# Altium schematic sheet Wifi_Coprocessor.SchDoc
size A3; SheetNumber: 4; SheetTotal: 5
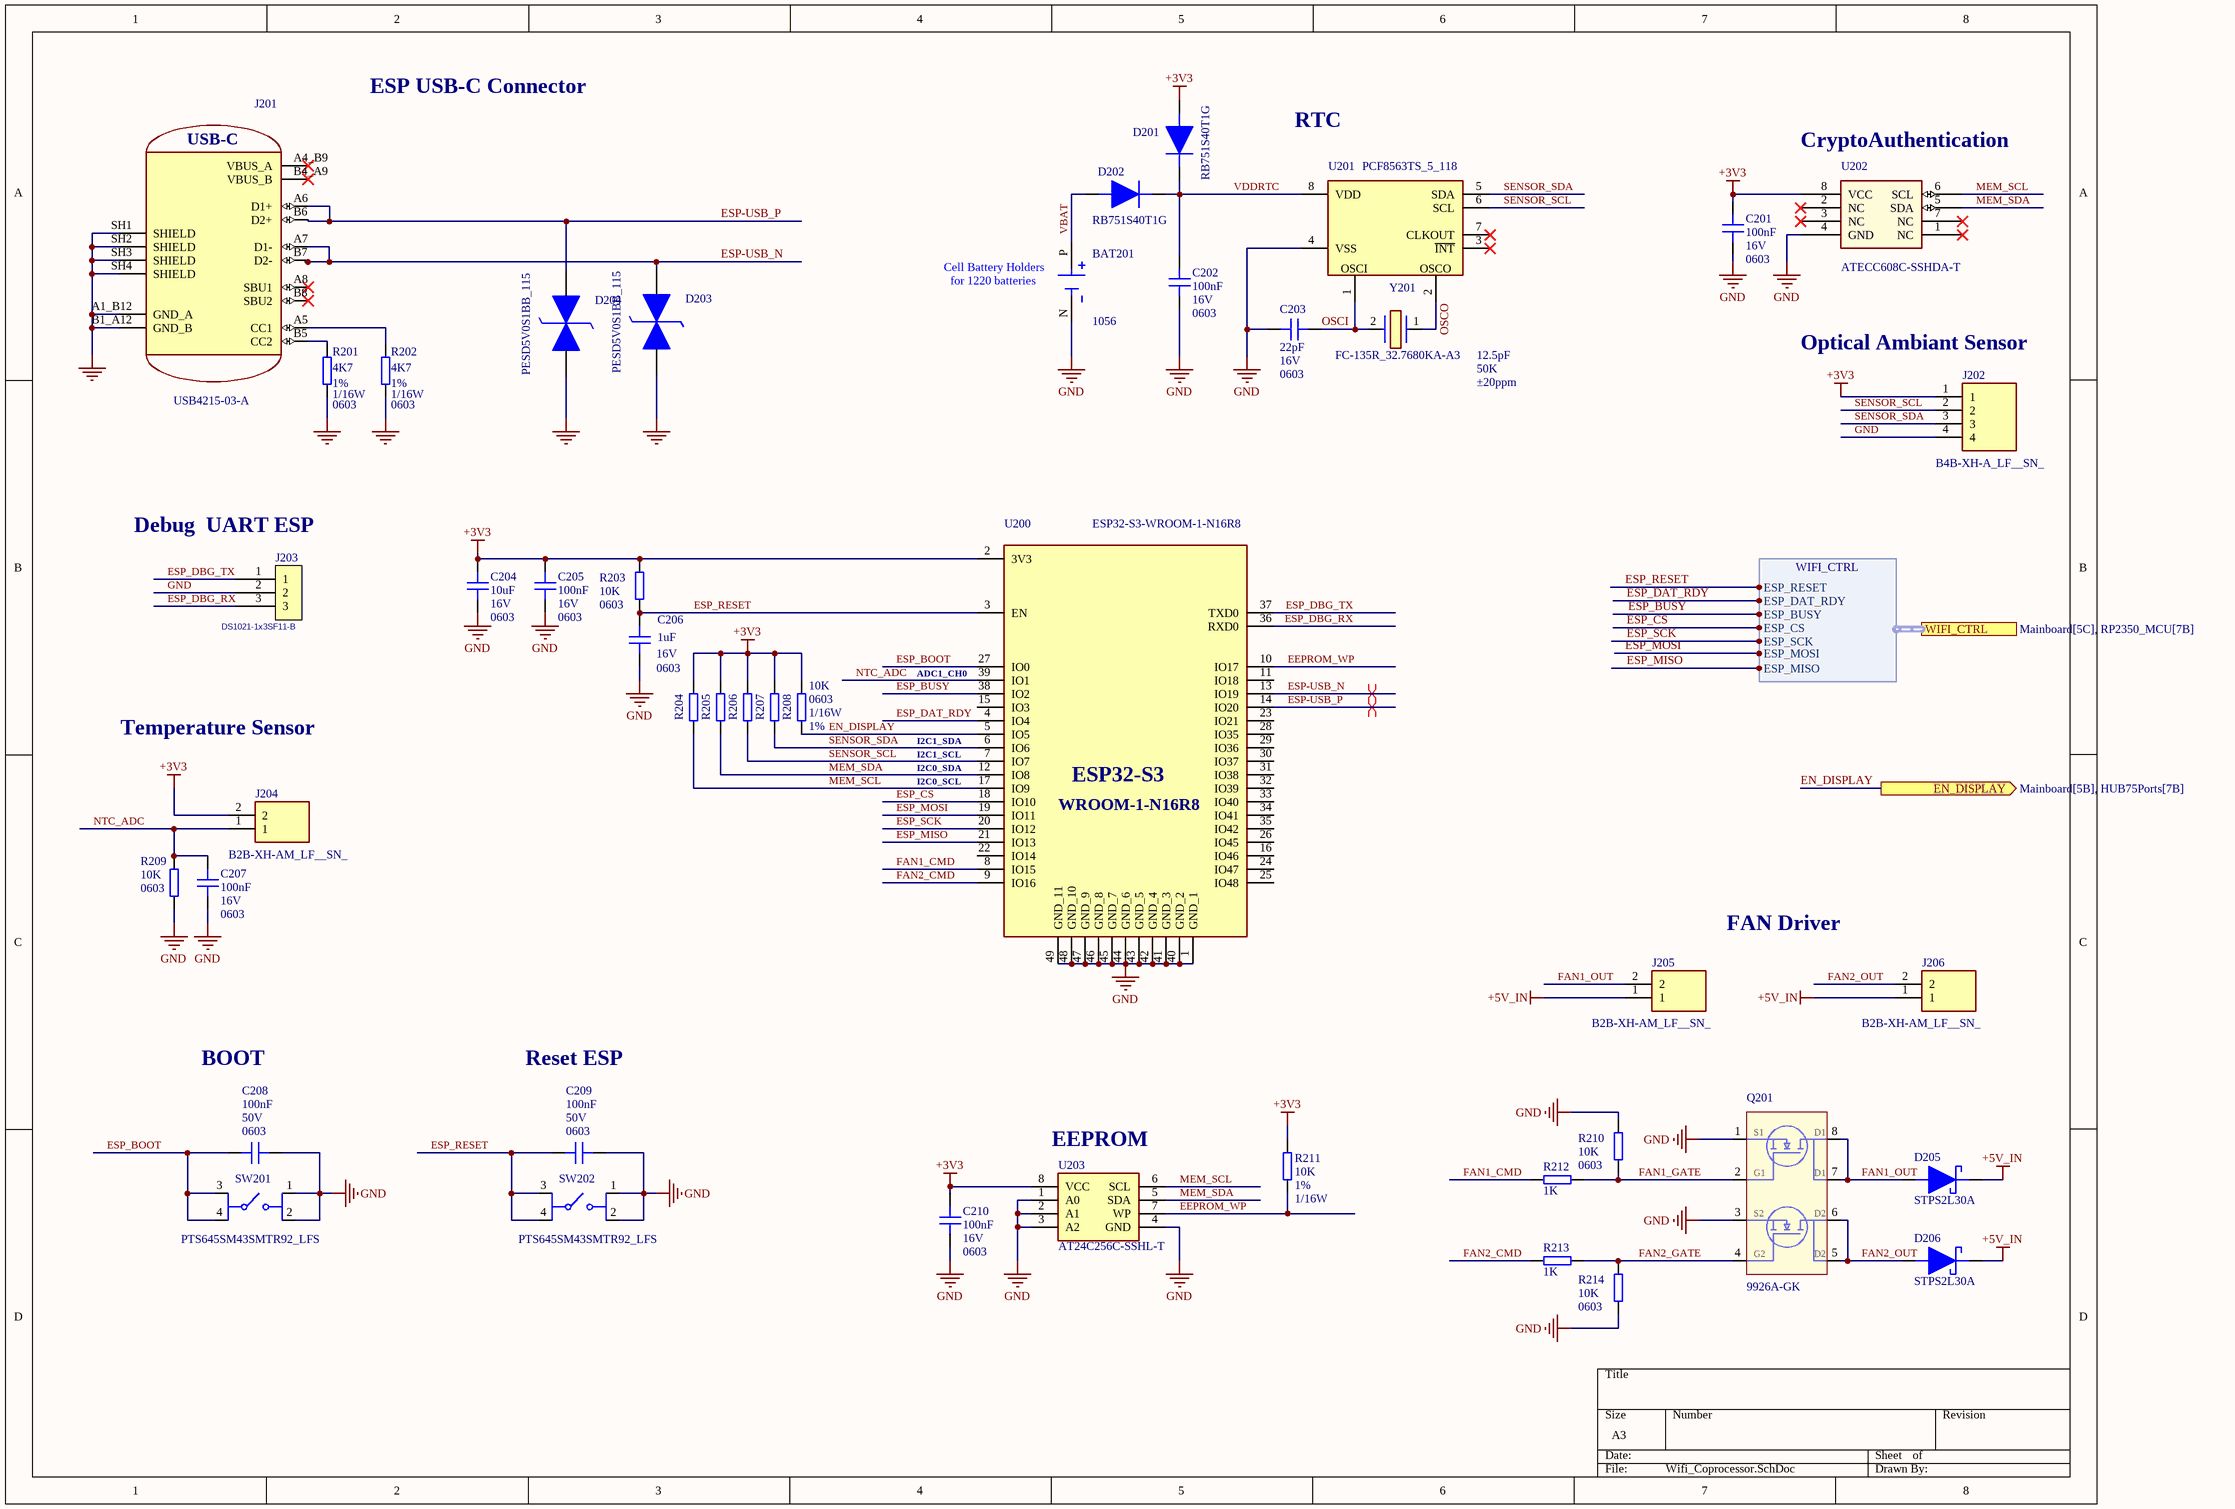
[diagram p0: Wifi_Coprocessor.SchDoc]

## Parts
BAT201  1056  [1056]
C201  100nF  Voltage: 16V  Package: 0603  [C0603]
C202  100nF  Voltage: 16V  Package: 0603  [C0603]
C203  22pF  Voltage: 16V  Package: 0603  [C0603]
C204  10uF  Voltage: 16V  Package: 0603  [C0603]
C205  100nF  Voltage: 16V  Package: 0603  [C0603]
C206  1uF  Voltage: 16V  Package: 0603  [C0603]
C207  100nF  Voltage: 16V  Package: 0603  [C0603]
C208  100nF  Voltage: 50V  Package: 0603  [C0603]
C209  100nF  Voltage: 50V  Package: 0603  [C0603]
C210  100nF  Voltage: 16V  Package: 0603  [C0603]
D201  RB751S40T1G  [SODFL1608X70N]
D202  RB751S40T1G  [SODFL1608X70N]
D203  PESD5V0S1BB_115  [SODFL1608X65N]
D204  PESD5V0S1BB_115  [SODFL1608X65N]
D205  STPS2L30A  [SMA_STM]
D206  STPS2L30A  [SMA_STM]
J201  USB4215-03-A  [GCT_USB4215-03-A_REVA]
J202  B4B-XH-A_LF__SN_  [B4BXHALFSN]
J203  DS1021-1x3SF11-B  [HDR-TH_3P-P2.54-V-M]
J204  B2B-XH-AM_LF__SN_  [B2BXHAMLFSN]
J205  B2B-XH-AM_LF__SN_  [B2BXHAMLFSN]
J206  B2B-XH-AM_LF__SN_  [B2BXHAMLFSN]
Q201  9926A-GK  [SOIC127P600X175-8N]
R201  4K7  Package: 0603  Tolerence: 1%  Power: 1/16W  [R0603_1608]
R202  4K7  Package: 0603  Tolerence: 1%  Power: 1/16W  [R0603_1608]
R203  10K  Package: 0603  [R0603_1608]
R204  10K  [R0603_1608]  (value not drawn)
R205  10K  [R0603_1608]  (value not drawn)
R206  10K  [R0603_1608]  (value not drawn)
R207  10K  [R0603_1608]  (value not drawn)
R208  Package: 0603  Tolerence: 1%  Power: 1/16W  [R0603_1608]  (hidden comment: 10K)
R209  10K  Package: 0603  [R0603_1608]
R210  10K  Package: 0603  [R0603_1608]
R211  Tolerence: 1%  Power: 1/16W  [R0603_1608]  (hidden comment: 10K)
R212  1K  [R0603_1608]
R213  1K  [R0603_1608]
R214  10K  Package: 0603  [R0603_1608]
SW201  PTS645SM43SMTR92_LFS  [PTS645SM43SMTR92LFS]
SW202  PTS645SM43SMTR92_LFS  [PTS645SM43SMTR92LFS]
U200  ESP32-S3-WROOM-1-N16R8  [ESP32S3WROOM1N16R8]
U201  PCF8563TS_5_118  [SOT65P490X110-8N]
U202  ATECC608C-SSHDA-T  [SOIC8_SWB_MCH]
U203  AT24C256C-SSHL-T  [24LC32A]
Y201  FC-135R_32.7680KA-A3  Load Capacitance: 12.5pF  ESR: 50K  Parameter 1: ±20ppm  [FC135R327680KAA3]

## Ports
EN_DISPLAY (out, see Mainboard[5B], HUB75Ports[7B]), WIFI_CTRL (harness WIFI_CTRL, see Mainboard[5C], RP2350_MCU[7B])

## Harnesses
WIFI_CTRL: ESP_RESET, ESP_DAT_RDY, ESP_BUSY, ESP_CS, ESP_SCK, ESP_MOSI, ESP_MISO

## Nets
+3V3: C201.2 C204.2 C205.2 C210.2 D201.2(A) J202.1 J204.2 R203.1 R204.1 R205.1 R206.1 R207.1 R208.1 R211.1 U200.2(3V3) U202.8(VCC) U203.8(VCC)
+5V_IN: D205.1(K) D206.1(K) J205.1 J206.1
GND: BAT201.N(NEG) C201.1 C202.1 C203.2 C204.1 C205.1 C206.1 C207.1 C208.1 C209.1 C210.1 D203.1(K1) D204.1(K1) J201.A1_B12(GND_A) J201.B1_A12(GND_B) J201.SH1(SHIELD) J201.SH2(SHIELD) J201.SH3(SHIELD) J201.SH4(SHIELD) J202.4 J203.2 Q201.1(S1) Q201.3(S2) R201.1 R202.1 R209.2 R210.1 R214.2 SW201.1(NO_1) SW201.2(NO_2) SW202.1(NO_1) SW202.2(NO_2) U200.1(GND_1) U200.40(GND_2) U200.41(GND_3) U200.42(GND_4) U200.43(GND_5) U200.44(GND_6) U200.45(GND_7) U200.46(GND_8) U200.47(GND_9) U200.48(GND_10) U200.49(GND_11) U201.4(VSS) U202.4(GND) U203.1(A0) U203.2(A1) U203.3(A2) U203.4(GND)
EEPROM_WP: R211.2 U200.10(IO17) U203.7(WP)
EN_DISPLAY: R208.2 U200.5(IO5) ; port EN_DISPLAY
ESP-USB_N: D203.2(K2) J201.A7(D1-) J201.B7(D2-) U200.13(IO19)
ESP-USB_P: D204.2(K2) J201.A6(D1+) J201.B6(D2+) U200.14(IO20)
ESP_BOOT: C208.2 SW201.3(COM_1) SW201.4(COM_2) U200.27(IO0)
ESP_BUSY: U200.38(IO2) ; port WIFI_CTRL.ESP_BUSY
ESP_CS: U200.18(IO10) ; port WIFI_CTRL.ESP_CS
ESP_DAT_RDY: U200.4(IO4) ; port WIFI_CTRL.ESP_DAT_RDY
ESP_DBG_RX: J203.3 U200.36(RXD0)
ESP_DBG_TX: J203.1 U200.37(TXD0)
ESP_MISO: U200.21(IO13) ; port WIFI_CTRL.ESP_MISO
ESP_MOSI: U200.19(IO11) ; port WIFI_CTRL.ESP_MOSI
ESP_RESET: C206.2 C209.2 R203.2 SW202.3(COM_1) SW202.4(COM_2) U200.3(EN) ; port WIFI_CTRL.ESP_RESET
ESP_SCK: U200.20(IO12) ; port WIFI_CTRL.ESP_SCK
FAN1_CMD: R212.1 U200.8(IO15)
FAN1_GATE: Q201.2(G1) R210.2 R212.2
FAN1_OUT: D205.2(A) J205.2 Q201.7(D1) Q201.8(D1)
FAN2_CMD: R213.1 U200.9(IO16)
FAN2_GATE: Q201.4(G2) R213.2 R214.1
FAN2_OUT: D206.2(A) J206.2 Q201.5(D2) Q201.6(D2)
MEM_SCL: R204.2 U200.17(IO9) U202.6(SCL) U203.6(SCL)
MEM_SDA: R205.2 U200.12(IO8) U202.5(SDA) U203.5(SDA)
NTC_ADC: C207.2 J204.1 R209.1 U200.39(IO1)
OSCI: C203.1 U201.1(OSCI) Y201.2(CRYSTAL_2)
OSCO: U201.2(OSCO) Y201.1
SENSOR_SCL: J202.2 R206.2 U200.7(IO7) U201.6(SCL)
SENSOR_SDA: J202.3 R207.2 U200.6(IO6) U201.5(SDA)
VBAT: BAT201.P(POS) D202.2(A)
VDDRTC: C202.2 D201.1(K) D202.1(K) U201.8(VDD)
NetJ201_A5: J201.A5(CC1) R202.2
NetJ201_B5: J201.B5(CC2) R201.2

Not connected (* = marked no-connect by the designer): J201 A4_B9(VBUS_A)* A8(SBU1)* B4_A9(VBUS_B)* B8(SBU2)*; U200 11(IO18) 15(IO3) 16(IO46) 22(IO14) 23(IO21) 24(IO47) 25(IO48) 26(IO45) 28(IO35) 29(IO36) 30(IO37) 31(IO38) 32(IO39) 33(IO40) 34(IO41) 35(IO42); U201 3(~{INT})* 7(CLKOUT)*; U202 1(NC)* 2(NC)* 3(NC)* 7(NC)*

## Layout directives
differential pair; differential pair class DIFF_USB: ESP-USB_N, ESP-USB_P

## Notes on the sheet
- ESP USB-C Connector
- RTC
- (near U202) CryptoAuthentication
- (near BAT201) Cell Battery Holders
- (near BAT201) for 1220 batteries
- (near J202) Optical Ambiant Sensor
- (near J203) Debug  UART ESP
- (near U200) ADC1_CH0
- Temperature Sensor
- (near U200) I2C1_SDA
- (near U200) I2C1_SCL
- (near U200) I2C0_SDA
- (near U200) I2C0_SCL
- FAN Driver
- BOOT
- Reset ESP
- (near U203) EEPROM
- (in symbol ESP32-S3-WROOM-1-N16R8) ESP32-S3; WROOM-1-N16R8
- (in symbol USB4215-03-A) USB-C

## Library data of the parts
BAT201 = 1056: Coin Cell Battery Holders S/M Coin cell hldr for 1220 batteries; Manufacturer_Name: Keystone Electronics; Geometry.Height: 4.24mm; Manufacturer_Part_Number: 1056; Mouser Part Number: 534-1056; Mouser Price/Stock: https://www.mouser.co.uk/ProductDetail/Keystone-Electronics/1056?qs=sZfk%252BfAlGe4w00bCJntjFg%3D%3D; Arrow Part Number: *; Arrow Price/Stock: *; Datasheet Link: https://www.keyelco.com/product.cfm/product_id/715
C201-C203 C205 C207-C210 = CAP_0603_16V: SMD Capacitor; Designator: ?; Dielectric: ?; Manufacturer Reference: ?; Tolerance: ?; Power: ?; Excepted: ?
  C201 C202 C205 C207-C210: Value: 100nF
  C203: Value: 22pF
C204 C206 = CAP_0603_16V: SMD Capacitor; Tolerance: 10%; Temperature Coefficient: X7R; Designator: ?; Dielectric: ?; Manufacturer Reference: ?; Power: ?; Excepted: ?
  C204: Value: 10uF
  C206: Value: 1uF
D201 D202 = RB751S40T1G: Extremely Fast Switching Speed; Extremely Low Forward Voltage: 0.28 V (Typ) @ IF = 1.0 mAdc; Low Reverse Current; LeadFree Plating; These Devices are PbFree, Halogen Free/BFR Free and are RoHS Compliant; Manufacturer_Name: onsemi; Geometry.Height: 0.7mm; Manufacturer_Part_Number: RB751S40T1G; Mouser Part Number: 863-RB751S40T1G; Mouser Price/Stock: https://www.mouser.co.uk/ProductDetail/onsemi/RB751S40T1G?qs=xZq1yRCsb1eQ%2Ff4mzLQKzQ%3D%3D; Arrow Part Number: RB751S40T1G; Arrow Price/Stock: https://www.arrow.com/en/products/rb751s40t1g/on-semiconductor.html?utm_currency=USD&region=asia; Datasheet Link: https://www.onsemi.com/pub/Collateral/RB751S40T1-D.PDF
D203 D204 = PESD5V0S1BB_115: PESD5V0S1BB - Bidirectional ESD protection diode; Manufacturer_Name: Nexperia; Manufacturer_Part_Number: PESD5V0S1BB,115; Geometry.Height: 0.65mm; Mouser Part Number: 771-PESD5V0S1BB-T/R; Mouser Price/Stock: https://www.mouser.co.uk/ProductDetail/Nexperia/PESD5V0S1BB115?qs=LOCUfHb8d9vW06zz0pOppQ%3D%3D; Arrow Part Number: PESD5V0S1BB,115; Arrow Price/Stock: https://www.arrow.com/en/products/pesd5v0s1bb115/nexperia?region=nac; Datasheet Link: https://assets.nexperia.com/documents/data-sheet/PESD5V0S1BB.pdf
D205 D206 = STPS2L30A: 30 V, 2 A Low Drop Power Schottky Rectifier; Manufacturer_Name: STMicroelectronics; Copyright: Copyright (C) 2025 Ultra Librarian. All rights reserved.; Manufacturer_Part_Number: STPS2L30A
J201 = USB4215-03-A: USB-C (USB TYPE-C) USB 2.0 Receptacle Connector 24 (16+8 Dummy) Position Surface Mount, Right Angle; Through Hole; MF: Global Connector Technology; SnapEDA_Link: https://www.snapeda.com/parts/USB4215-03-A/Global+Connector+Technology/view-part/?ref=snap; Package: None; Value: *; MP: USB4215-03-A; Check_prices: https://www.snapeda.com/parts/USB4215-03-A/Global+Connector+Technology/view-part/?ref=eda
J202 = B4B-XH-A_LF__SN_: CONN HEADER VERT 4POS 2.5MM; Manufacturer_Name: JST (JAPAN SOLDERLESS TERMINALS); Manufacturer_Part_Number: B4B-XH-A(LF)(SN); Geometry.Height: 7mm; Mouser Part Number: 306-B4BXHALFSN; Mouser Price/Stock: https://www.mouser.co.uk/ProductDetail/JST-Commercial/B4B-XH-ALFSN?qs=cdbOS8ANM9CfC08d%252BywhFw%3D%3D; Arrow Part Number: B4B-XH-A(LF)(SN); Arrow Price/Stock: https://www.arrow.com/en/products/b4b-xh-a-lf-sn/jst-manufacturing.html?utm_currency=USD&region=europe; Datasheet Link: https://datasheet.lcsc.com/szlcsc/JST-Sales-America-B4B-XH-A-LF-SN_C144395.pdf
J203 = DS1021-1x3SF11-B: Manufacturer: CONNFLY; Add into BOM: yes; Pin Structure: 1x3P; Pitch: 2.54mm; Circluar Pins/Square Pins: Pin Header; Current Rating: 3A; Voltage Rating (Max): 250V; Symbol: DS1021-1X3SF11-B; Device: DS1021-1x3SF11-B; LCSC Part Name: 1x3P 间距:2.54mm 方针 直插; Supplier Part: C7430359; Manufacturer Part: DS1021-1x3SF11-B; Supplier Footprint: 插件,P=2.54mm; JLCPCB Part Class: Extended Part; Datasheet: https://item.szlcsc.com/datasheet/DS1021-1x3SF11-B/8430012.html; Supplier: LCSC; Convert to PCB: yes; Mounting Type: Through Hole; Number of Rows: 1; Number of Pins: 3P; Contact Material: Copper Alloy; Contact Plating: Gold; Operating Temperature: -40℃~+105℃; Color: Black; Designator: ?; Dielectric: ?; Excepted: ?; Package: ?; Power: ?; Tolerance: ?; Value: ?; Voltage: ?
J204-J206 = B2B-XH-AM_LF__SN_: CONN HEADER VERT 2POS 2.5MM; Manufacturer_Name: JST (JAPAN SOLDERLESS TERMINALS); Manufacturer_Part_Number: B2B-XH-AM(LF)(SN); Geometry.Height: 7mm; Mouser Part Number: 306-B2B-XH-AMLFSNP; Mouser Price/Stock: https://www.mouser.co.uk/ProductDetail/JST-Commercial/B2B-XH-AMLFSN?qs=cdbOS8ANM9BJgHgwB7WxQw%3D%3D; Arrow Part Number: B2B-XH-AM(LF)(SN); Arrow Price/Stock: https://www.arrow.com/en/products/b2b-xh-am-lf-sn/jst-manufacturing.html?utm_currency=USD&region=europe; Datasheet Link: https://www.jst-mfg.com/product/pdf/eng/eXH.pdf
Q201 = 9926A-GK: Mosfet Canal N, RDS(ON) = 30 m @ VGS = 4.5 V; Low gate charge; RDS(ON) = 43 m @ VGS = 2.5 V; Optimized for use in battery protection circuits; +/-10 VGSS allows for wide operating voltage range; 6.5 A, 20 V; Manufacturer_Name: onsemi; Manufacturer_Part_Number: FDS9926A; Geometry.Height: 1.75mm; Mouser Part Number: 512-FDS9926A; Mouser Price/Stock: https://www.mouser.co.uk/ProductDetail/onsemi-Fairchild/FDS9926A?qs=HK%252BeIG1iaagpgrEVRWCDdA%3D%3D; Arrow Part Number: FDS9926A; Arrow Price/Stock: https://www.arrow.com/en/products/fds9926a/on-semiconductor?utm_currency=USD&region=nac; Datasheet Link: https://www.onsemi.com/pub/Collateral/FDS9926A-D.PDF
R201 R202 R208 R211 = Resistor: SMD Resistor; Designator: ?; Voltage: ?; Dielectric: ?; Manufacturer Reference: ?; Excepted: ?
  R201 R202: Value: 4K7
  R208: Value: 10K
  R211: Value: 10K; Package: 0603
R203-R207 R209 R210 R212-R214 = Resistor: SMD Resistor; Tolerence: 1%; Power: 1/16W; Designator: ?; Voltage: ?; Dielectric: ?; Manufacturer Reference: ?; Excepted: ?
  R203 R209 R210 R214: Value: 10K
  R204-R207: Value: 10K; Package: 0603
  R212 R213: Value: 1K; Package: 0603
SW201 SW202 = PTS645SM43SMTR92_LFS: Tactile Switch, PTS645 Series, Top Actuated, Surface Mount, Round Button, 160 gf, 50mA at 12VDC; Manufacturer_Name: LITTELFUSE; Manufacturer_Part_Number: PTS645SM43SMTR92 LFS; Datasheet Link: https://www.ckswitches.com/media/1471/pts645.pdf; Height: 4.4mm; Mouser Part Number: 611-PTS645SM43SMTR92; Mouser Price/Stock: https://www.mouser.co.uk/ProductDetail/CK/PTS645SM43SMTR92-LFS?qs=Imq1NPwxi75hrUk5xRQGSg%3D%3D; Arrow Part Number: PTS645SM43SMTR92 LFS; Arrow Price/Stock: https://www.arrow.com/en/products/pts645sm43smtr92lfs/ck?utm_currency=USD&region=nac
U200 = ESP32-S3-WROOM-1-N16R8: Esspressif Multiprotocol Modules SMD Module, ESP32-S3R8, 3.3V, 8 MB Octal PSRAM Die, 16 MB Quad SPI Flash, PCB Antenna; Manufacturer_Name: Espressif Systems; Geometry.Height: 3.25mm; Manufacturer_Part_Number: ESP32-S3-WROOM-1-N16R8; Mouser Part Number: 356-ESP32S3WRM1N16R8; Mouser Price/Stock: https://www.mouser.co.uk/ProductDetail/Espressif-Systems/ESP32-S3-WROOM-1-N16R8?qs=Li%252BoUPsLEnvQc9gW6AMhZg%3D%3D; Arrow Part Number: *; Arrow Price/Stock: *; Datasheet Link: https://www.espressif.com/sites/default/files/documentation/esp32-s3-wroom-1_wroom-1u_datasheet_en.pdf
U201 = PCF8563TS_5_118: NXP - PCF8563TS/5,118 - REAL TIME CLOCK(RTC), 5.5V, I2C, TSSOP-8; Geometry.Height: 1.1mm; Manufacturer_Name: NXP; Manufacturer_Part_Number: PCF8563TS/5,118; Mouser Part Number: 771-PCF8563TS/5118; Mouser Price/Stock: https://www.mouser.co.uk/ProductDetail/NXP-Semiconductors/PCF8563TS-5118?qs=beN0Cyoe8Ynnzly4fQaDyw%3D%3D; Arrow Part Number: PCF8563TS/5,118; Arrow Price/Stock: https://www.arrow.com/en/products/pcf8563ts5118/nxp-semiconductors.html?utm_currency=USD&region=nac; Datasheet Link: http://www.nxp.com/docs/en/data-sheet/PCF8563.pdf
U202 = ATECC608C-SSHDA-T: Security ICs / Authentication ICs ECC/ECDH, I2C, SOIC T/R; Manufacturer_Name: Microchip; Copyright: Copyright (C) 2025 Ultra Librarian. All rights reserved.; Manufacturer_Part_Number: ATECC608C-SSHDA-T; RefDes: RefDes; Type: Type
U203 = AT24C256C-SSHL-T: EEPROM 256K (32K X 8), 2-WI 1.8V, SOIC; Manufacturer_Name: Microchip; Geometry.Height: 1.75mm; Manufacturer_Part_Number: AT24C256C-SSHL-T; Mouser Part Number: 556-AT24C256C-SSHL-T; Mouser Price/Stock: https://www.mouser.co.uk/ProductDetail/Microchip-Technology/AT24C256C-SSHL-T?qs=fzsaQExJLyR3ptk4tHE3tA%3D%3D; Arrow Part Number: AT24C256C-SSHL-T; Arrow Price/Stock: https://www.arrow.com/en/products/at24c256c-sshl-t/microchip-technology?utm_currency=USD&region=nac; Datasheet Link: http://www.atmel.com/Images/Atmel-8568-SEEPROM-AT24C256C-Datasheet.pdf
Y201 = FC-135R_32.7680KA-A3: Crystal or Oscillator, 32.768 kHz ±20ppm Crystal 12.5pF 50 kOhms 2-SMD, No Lead; Manufacturer_Name: Epson Timing; Manufacturer_Part_Number: FC-135R 32.7680KA-A3; Datasheet Link: https://eu.mouser.com/datasheet/2/137/FC_255_en-1649561.pdf; Height: 0.9mm; Mouser Part Number: 732-5R32.7680KA-A3; Mouser Price/Stock: https://www.mouser.co.uk/ProductDetail/Epson-Timing/FC-135R-32.7680KA-A3?qs=f9yNj16SXrIR19rZDPQCyw%3D%3D; Arrow Part Number: FC-135R 32.7680KA-A3; Arrow Price/Stock: https://www.arrow.com/en/products/fc-135r32.7680ka-a3/epson-electronics-america?region=nac